# Altium project SpaceInvaders.PrjPcb
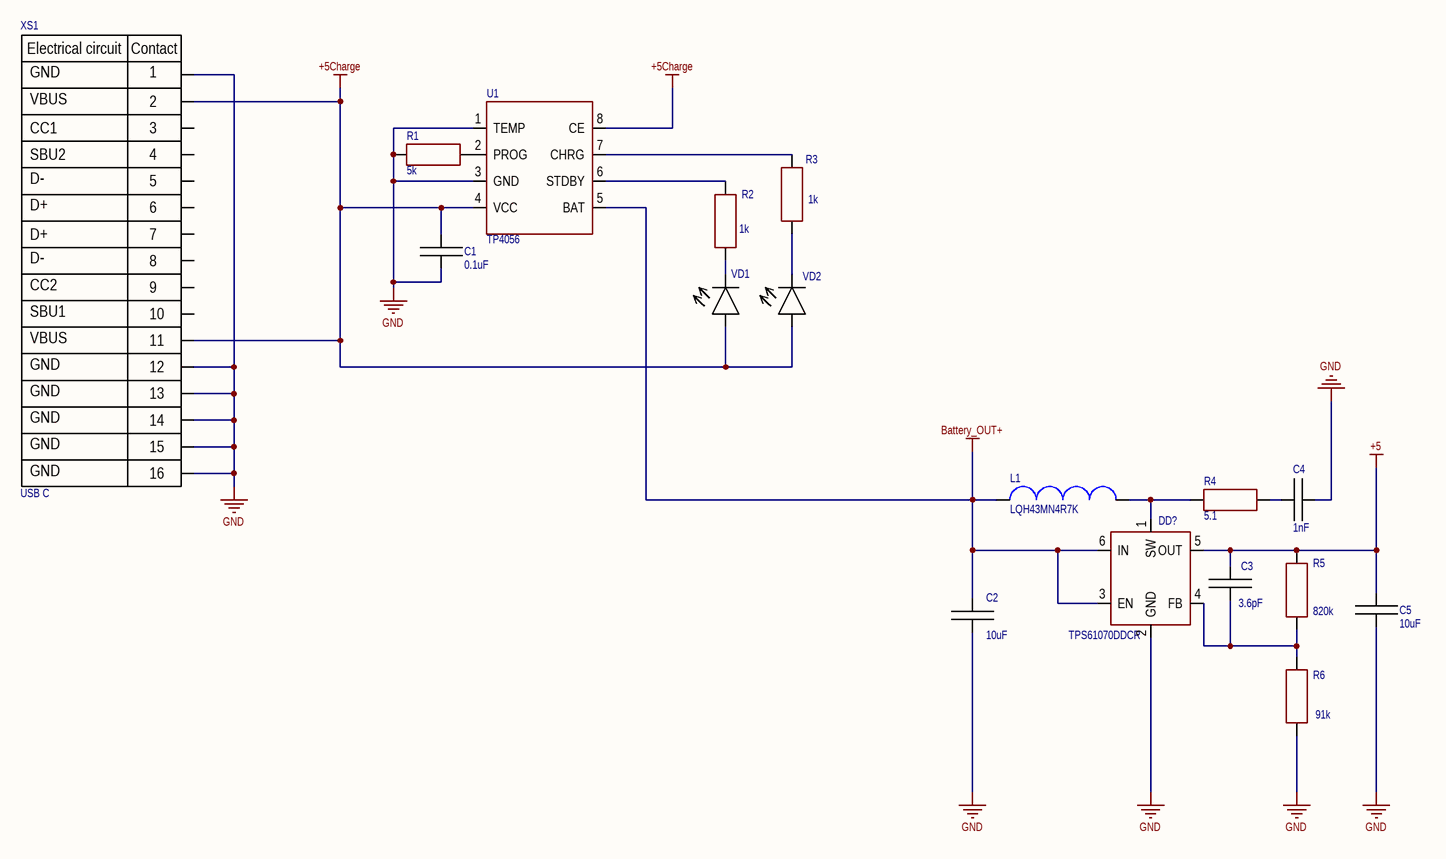
[diagram p0: ChargeBlock.SchDoc]
2 sheets, 69 parts. Net scope: global (net labels, ports and power ports of the same name join across sheets).
Board file: PCB1.PcbDoc
Sheets:
  ChargeBlock.SchDoc
  ControlBlock.SchDoc

## Sheet ChargeBlock.SchDoc
size 420 x 297 mm; PageSetup: Record=PageOptions|CenterHorizontal=True|CenterVertical=True|PrintScale=0.94|XCorrection=1.00|YCorrection=1.00|PrintKind=1|BorderSize=5000000|LeftOffset=0|BottomOffset=0|Orientation=1|PaperLength=1000|PaperWidth=1000|Scale=100|PaperSource=7|PrintQuality=-4|MediaType=1|DitherType=10|PaperKind=A4|PrintScaleMode=1; DecimalNumber: 334115.001Э3; Name: Игровая консоль; Address1: Address1; Address2: Address2; Address3: Address3; Address4: Address4; SheetNumber: 1; SheetTotal: 2; Scale: 1:1; Разраб.: Навумчик; Обозначение документа: ВУКО.467419.001Э3; Наименование организации: ООО "VYKO"; Наименование изделия 1: Space Invaders; Наименование изделия 2: Схема электрическая; Наименование изделия 3: принципиальная; Нач. отд.: Нач. отд.

### Parts
C1  0.1uF  [Cap 0603]
C2  10uF  [Cap 0603]
C3  3.6pF  [Cap 0603]
C4  1nF  [Cap 0603]
C5  10uF  [Cap 0603]
DD1  TPS61070DDCR  [SOT23-6]
L1  LQH43MN4R7K  [LQH43M]
R1  5k  [Resistor 0603]
R2  1k  [Resistor 0603]
R3  1k  [Resistor 0603]
R4  5.1  [Resistor 0603]
R5  820k  [Resistor 0603]
R6  91k  [Resistor 0603]
U1  TP4056  [SOP8]
VD1  LED 0603  [VD0603]  (value not drawn)
VD2  LED 0603  [VD0603]  (value not drawn)
XS1  USB C  [USB C 16]

### Nets
+5: C3.2 C5.1 DD1.5(OUT) R5.1
+5Charge: C1.2 U1.4(VCC) U1.8(CE) VD1.1(+) VD2.1(+) XS1.2(VBUS) XS1.11(VBUS)
Battery_OUT+: C2.2 DD1.3(EN) DD1.6(IN) L1.1 U1.5(BAT)
GND: C1.1 C2.1 C4.2 C5.2 DD1.2(GND) R1.1 R6.2 U1.1(TEMP) U1.3(GND) XS1.1(GND) XS1.12(GND) XS1.13(GND) XS1.14(GND) XS1.15(GND) XS1.16(GND)
NetC3_1: C3.1 DD1.4(FB) R5.2 R6.1
NetC4_1: C4.1 R4.2
NetDD1_1: DD1.1(SW) L1.2 R4.1
NetR1_2: R1.2 U1.2(PROG)
NetR2_1: R2.1 U1.6(STDBY)
NetR2_2: R2.2 VD1.2(-)
NetR3_1: R3.1 U1.7(CHRG)
NetR3_2: R3.2 VD2.2(-)

Not connected (* = marked no-connect by the designer): XS1 3(CC1) 4(SBU2) 5(D-) 6(D+) 7(D+) 8(D-) 9(CC2) 10(SBU1)

### Notes on the sheet
- Перв. примен.
- Справ. №
- Подп. и дата
- Инв. № дубл.
- Взам. инв. №
- Разраб.
- Изм.
- Лист
- № докум.
- Подп.
- Дата
- Лит.
- Масса
- Масштаб
- Пров.
- Т.контр.
- Листов
- Инв. № подл.
- Утв.
- Н.контр.
- Копировал
- Формат А3
- (in symbol USB C 16) Electrical circuit; Contact

### Library data of the parts
C1-C5 = Capacitor: Manufacturer: *; Part Number: *; Tolerance: *; Voltage Rating: *; Dielectric: *
L1 = Inductor
R1-R6 = Resistor: SMD 0402-0805; Manufacturer: *; Part number: *; Tolerance: *; Package: *
XS1 = USB C 16

## Sheet ControlBlock.SchDoc
size 420 x 297 mm; PageSetup: Record=PageOptions|CenterHorizontal=True|CenterVertical=True|PrintScale=0.94|XCorrection=1.00|YCorrection=1.00|PrintKind=1|BorderSize=5000000|LeftOffset=0|BottomOffset=0|Orientation=1|PaperLength=1000|PaperWidth=1000|Scale=100|PaperSource=7|PrintQuality=-4|MediaType=1|DitherType=10|PaperKind=A4|PrintScaleMode=1; DecimalNumber: 334115.001Э3; HeadOfSector: Нач. сектора; MainDevice: Перв.примен.; Name: Наименование; Разраб.: Навумчик; Пров.: Мазок; Утв.: Навумчик; Наименование изделия 2: Схема электрическая; Наименование изделия 3: принципиальная; Нач. отд.: Нач. отд.; Фамилия нач. отд.: Сидоров; Address1: Address1; Address2: Address2; Address3: Address3; Address4: Address4; SheetNumber: 2; SheetTotal: 2; Scale: 1:1; Обозначение документа: ВУКО.467419.001Э3
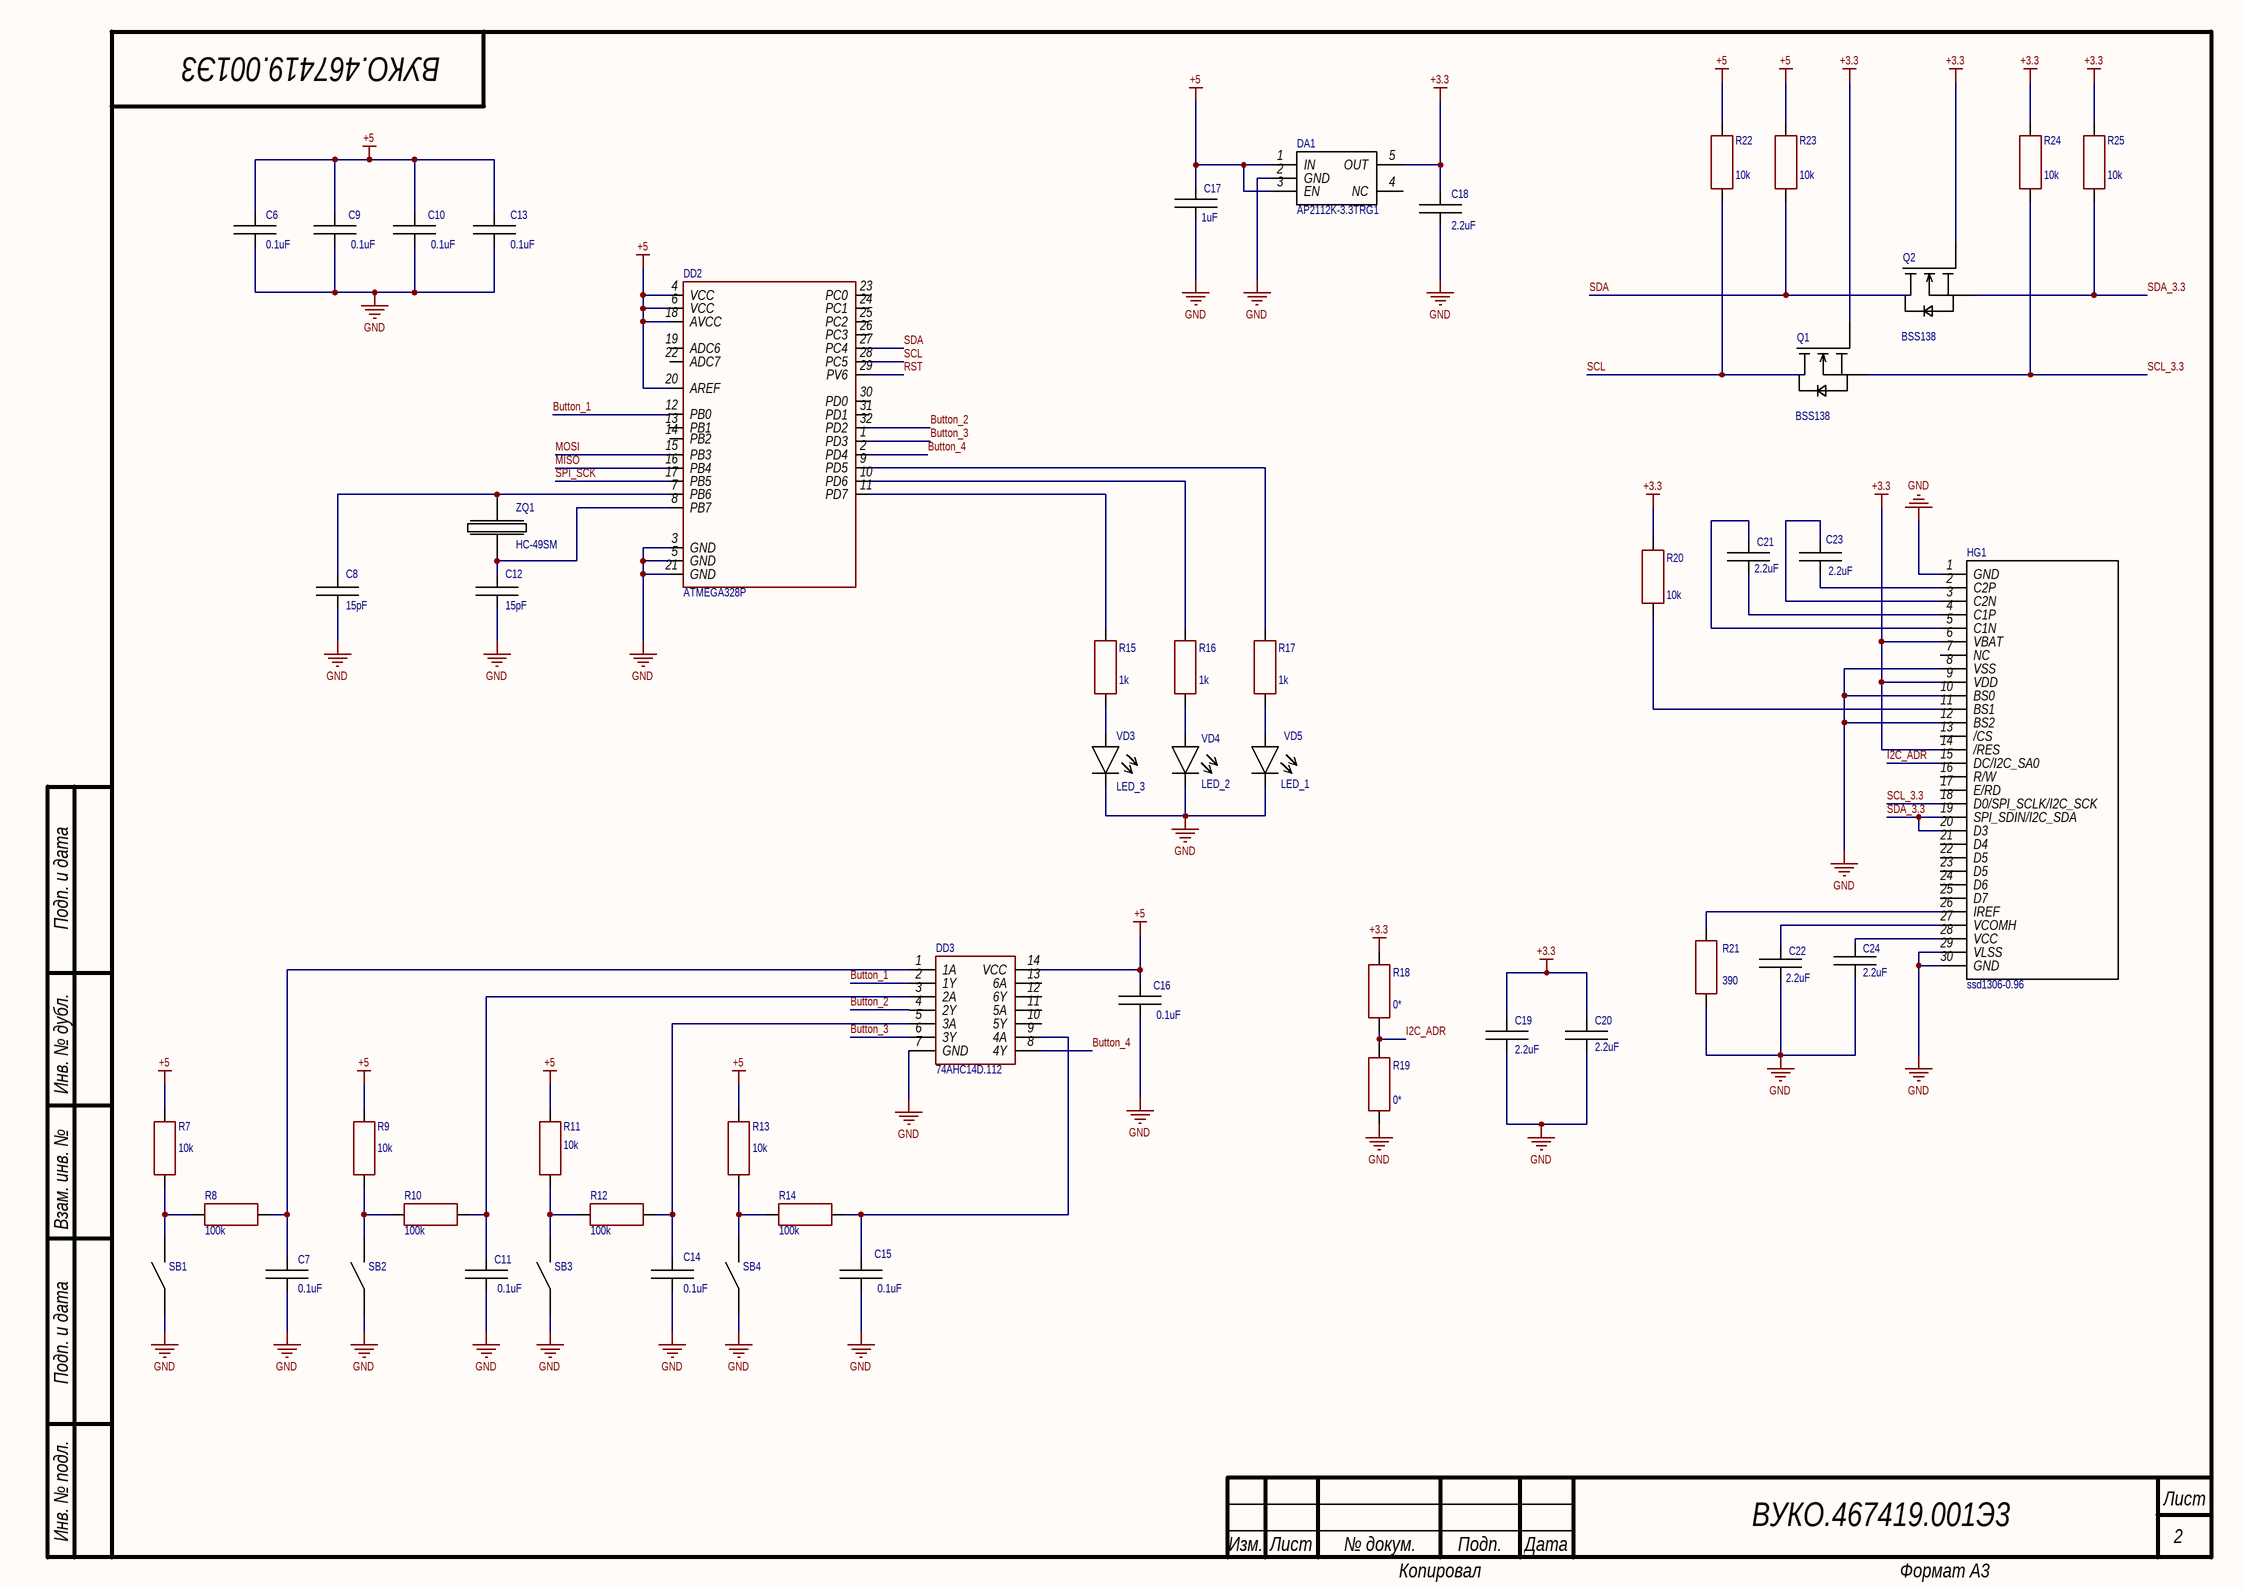
[diagram p1: ControlBlock.SchDoc]

### Parts
C6  0.1uF  [Cap 0603]
C7  0.1uF  [Cap 0603]
C8  15pF  [Cap 0603]
C9  0.1uF  [Cap 0603]
C10  0.1uF  [Cap 0603]
C11  0.1uF  [Cap 0603]
C12  15pF  [Cap 0603]
C13  0.1uF  [Cap 0603]
C14  0.1uF  [Cap 0603]
C15  0.1uF  [Cap 0603]
C16  0.1uF  [Cap 0603]
C17  1uF  [Cap 0603]
C18  2.2uF  [Cap 0603]
C19  2.2uF  [Cap 0603]
C20  2.2uF  [Cap 0603]
C21  2.2uF  [Cap 0603]
C22  2.2uF  [Cap 0603]
C23  2.2uF  [Cap 0603]
C24  2.2uF  [Cap 0603]
DA1  AP2112K-3.3TRG1  [SOT23-5]
DD2  ATMEGA328P  [TQFP32]
DD3  74AHC14D.112  [SOIC14]
HG1  ssd1306-0.96  [SSD1306_0.96_I2C]
Q1  BSS138  [SOT23]
Q2  BSS138  [SOT23]
R7  10k  [Resistor 0603]
R8  100k  [Resistor 0603]
R9  10k  [Resistor 0603]
R10  100k  [Resistor 0603]
R11  10k  [Resistor 0603]
R12  100k  [Resistor 0603]
R13  10k  [Resistor 0603]
R14  100k  [Resistor 0603]
R15  1k  [Resistor 0603]
R16  1k  [Resistor 0603]
R17  1k  [Resistor 0603]
R18  0*  [Resistor 0603]
R19  0*  [Resistor 0603]
R20  10k  [Resistor 0603]
R21  390  [Resistor 0603]
R22  10k  [Resistor 0603]
R23  10k  [Resistor 0603]
R24  10k  [Resistor 0603]
R25  10k  [Resistor 0603]
SB1  Button  [Button_6x6]  (value not drawn)
SB2  Button  [Button_6x6]  (value not drawn)
SB3  Button  [Button_6x6]  (value not drawn)
SB4  Button  [Button_6x6]  (value not drawn)
VD3  LED_3  [VD0603]
VD4  LED_2  [VD0603]
VD5  LED_1  [VD0603]
ZQ1  HC-49SM  [HC-49SM]

### Nets
+3.3: C18.2 C19.2 C20.2 DA1.5(OUT) HG1.6(VBAT) HG1.9(VDD) HG1.14(/RES) Q1.1(G) Q2.1(G) R18.1 R20.2 R24.2 R25.2
+5: C6.2 C9.2 C10.2 C13.2 C16.2 C17.2 DA1.1(IN) DA1.3(EN) DD2.4(VCC) DD2.6(VCC) DD2.18(AVCC) DD2.20(AREF) DD3.14(VCC) R7.1 R9.1 R11.1 R13.1 R22.2 R23.2
GND: C6.1 C7.1 C8.1 C9.1 C10.1 C11.1 C12.1 C13.1 C14.1 C15.1 C16.1 C17.1 C18.1 C19.1 C20.1 C22.1 C24.1 DA1.2(GND) DD2.3(GND) DD2.5(GND) DD2.21(GND) DD3.7(GND) HG1.1(GND) HG1.8(VSS) HG1.10(BS0) HG1.12(BS2) HG1.29(VLSS) HG1.30(GND) R19.2 R21.1 SB1.1 SB2.1 SB3.1 SB4.1 VD3.2(-) VD4.2(-) VD5.2(-)
Button_1: DD2.12(PB0) DD3.2(1Y)
Button_2: DD2.32(PD2) DD3.4(2Y)
Button_3: DD2.1(PD3) DD3.6(3Y)
Button_4: DD2.2(PD4) DD3.8(4Y)
I2C_ADR: HG1.15(DC/I2C_SA0) R18.2 R19.1
MISO: DD2.16(PB4)
MOSI: DD2.15(PB3)
RST: DD2.29(PV6)
SCL: DD2.28(PC5) Q1.3(S) R22.1
SCL_3.3: HG1.18(D0/SPI_SCLK/I2C_SCK) Q1.2(D) R24.1
SDA: DD2.27(PC4) Q2.3(S) R23.1
SDA_3.3: HG1.19(SPI_SDIN/I2C_SDA) HG1.20(D3) Q2.2(D) R25.1
SPI_SCK: DD2.17(PB5)
NetC7_2: C7.2 DD3.1(1A) R8.2
NetC8_2: C8.2 DD2.7(PB6) ZQ1.1
NetC11_2: C11.2 DD3.3(2A) R10.2
NetC12_2: C12.2 DD2.8(PB7) ZQ1.2
NetC14_2: C14.2 DD3.5(3A) R12.2
NetC15_2: C15.2 DD3.9(4A) R14.2
NetC21_1: C21.1 HG1.4(C1P)
NetC21_2: C21.2 HG1.5(C1N)
NetC22_2: C22.2 HG1.27(VCOMH)
NetC23_1: C23.1 HG1.3(C2N)
NetC23_2: C23.2 HG1.2(C2P)
NetC24_2: C24.2 HG1.28(VCC)
NetDD2_9: DD2.9(PD5) R17.2
NetDD2_10: DD2.10(PD6) R16.2
NetDD2_11: DD2.11(PD7) R15.2
NetHG1_11: HG1.11(BS1) R20.1
NetHG1_26: HG1.26(IREF) R21.2
NetR7_2: R7.2 R8.1 SB1.2
NetR9_2: R9.2 R10.1 SB2.2
NetR11_2: R11.2 R12.1 SB3.2
NetR13_2: R13.2 R14.1 SB4.2
NetR15_1: R15.1 VD3.1(+)
NetR16_1: R16.1 VD4.1(+)
NetR17_1: R17.1 VD5.1(+)

Not connected (* = marked no-connect by the designer): DA1 4(NC); DD2 13(PB1) 14(PB2) 19(ADC6) 22(ADC7) 23(PC0) 24(PC1) 25(PC2) 26(PC3) 30(PD0) 31(PD1); DD3 10(5Y) 11(5A) 12(6Y) 13(6A); HG1 7(NC) 13(/CS) 16(R/W) 17(E/RD) 21(D4) 22(D5) 23(D5) 24(D6) 25(D7)

### Notes on the sheet
- Подп. и дата
- Инв. № дубл.
- Взам. инв. №
- Инв. № подл.
- Изм.
- Лист
- № докум.
- Подп.
- Дата
- Копировал
- Формат А3

### Library data of the parts
C6-C24 = Capacitor: Manufacturer: *; Part Number: *; Tolerance: *; Voltage Rating: *; Dielectric: *
DA1 = Linear_stabilizer_3.3
HG1 = OLED_0.96
Q1 Q2 = N-Channel MOSFET
R7-R25 = Resistor: SMD 0402-0805; Manufacturer: *; Part number: *; Tolerance: *; Package: *
VD3-VD5 = LED

## Nets that join several sheets
+5: ChargeBlock (C3.2 C5.1 DD1.5 R5.1), ControlBlock (19 pins)
GND: ChargeBlock (15 pins), ControlBlock (37 pins)